# Altium schematic sheet Driver_Section.SchDoc
size A4; DocumentNumber: 6; SheetNumber: 6; SheetTotal: 8
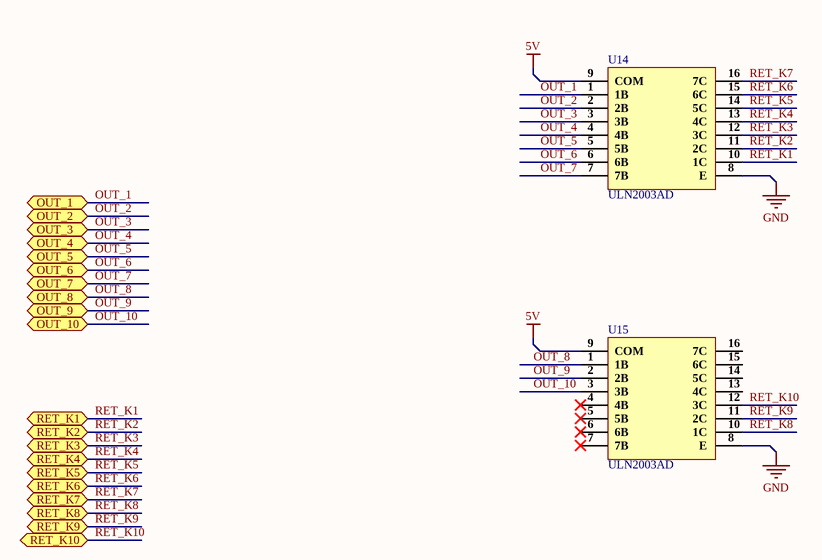
[diagram p0: Driver_Section.SchDoc]

## Parts
U14  ULN2003AD  [16-SOIC]
U15  ULN2003AD  [16-SOIC]

## Ports
OUT_1 (bidir), OUT_2 (bidir), OUT_3 (bidir), OUT_4 (bidir), OUT_5 (bidir), OUT_6 (bidir), OUT_7 (bidir), OUT_8 (bidir), OUT_9 (bidir), OUT_10 (bidir), RET_K1 (bidir), RET_K2 (bidir), RET_K3 (bidir), RET_K4 (bidir), RET_K5 (bidir), RET_K6 (bidir), RET_K7 (bidir), RET_K8 (bidir), RET_K9 (bidir), RET_K10 (bidir)

## Nets
5V: U14.9(COM) U15.9(COM)
GND: U14.8(E) U15.8(E)
OUT_1: U14.1(1B) ; port OUT_1
OUT_2: U14.2(2B) ; port OUT_2
OUT_3: U14.3(3B) ; port OUT_3
OUT_4: U14.4(4B) ; port OUT_4
OUT_5: U14.5(5B) ; port OUT_5
OUT_6: U14.6(6B) ; port OUT_6
OUT_7: U14.7(7B) ; port OUT_7
OUT_8: U15.1(1B) ; port OUT_8
OUT_9: U15.2(2B) ; port OUT_9
OUT_10: U15.3(3B) ; port OUT_10
RET_K1: U14.10(1C) ; port RET_K1
RET_K2: U14.11(2C) ; port RET_K2
RET_K3: U14.12(3C) ; port RET_K3
RET_K4: U14.13(4C) ; port RET_K4
RET_K5: U14.14(5C) ; port RET_K5
RET_K6: U14.15(6C) ; port RET_K6
RET_K7: U14.16(7C) ; port RET_K7
RET_K8: U15.10(1C) ; port RET_K8
RET_K9: U15.11(2C) ; port RET_K9
RET_K10: U15.12(3C) ; port RET_K10

Not connected (* = marked no-connect by the designer): U15 4(4B)* 5(5B)* 6(6B)* 7(7B)* 13(4C) 14(5C) 15(6C) 16(7C)

## Library data of the parts
U14 U15 = ULN2003AD: TRANS 7NPN DARL 50V 0.5A 16SOIC; Manufacturer: Texas Instruments; Max Collector Current: 500mA; Number of Elements: 7; Polarity: NPN; Collector Emitter Saturation Voltage: 1.1V; Collector-emitter Voltage-Max: 1.6V; Max Power Dissipation: 25W; Item Type: IC; Supplier 1: Arrow Electronics; Manufacturer Part Number: ULN2003AD; RoHS: Yes; Category: Integrated Circuits (ICs); Stock 1: 228; Pricing 1: 1=1.68680, 10=1.54200, 100=1.39890, 500=1.31050, 1000=1.23410 (USD); Mount: Surface Mount; Case/Package: SOIC; Number of Pins: 16; Weight: 0.004998oz; Contact Plating: Gold; Min Operating Temperature: -20°C; Max Operating Temperature: 70°C; Packaging: Rail/Tube; Collector Emitter Voltage (VCEO): 50V; Package Quantity: 40; Series: Automotive, AEC-Q100; Number of Drivers: 7; Collector Emitter Breakdown Voltage: 50V; Voltage Rating (DC): 50V; Current Rating: 500mA; Emitter Base Voltage (VEBO): 50V; Output Current: 500mA; Length: 9.9mm; Width: 3.91mm; Height: 1.58mm; Radiation Hardening: No; Lead Free: Lead Free; RoHS Compliant: Yes; Reach SVHC Compliant: Yes; ComponentLink1URL: https://datasheet.ciiva.com/15139/getdatasheetpartid-47909-15139875.pdf?src-supplier=Verical; ComponentLink1Description: https://datasheet.ciiva.com/15139/getdatasheetpartid-47909-15139875.pdf?src-supplier=Verical; ComponentLink2URL: https://datasheet.ciiva.com/1193/1908148-1193405.pdf?src-supplier=Element14; ComponentLink2Description: https://datasheet.ciiva.com/1193/1908148-1193405.pdf?src-supplier=Element14; ComponentLink3URL: https://datasheet.ciiva.com/1702/uln2003a-1702173.pdf?src-supplier=Digi-Key; ComponentLink3Description: https://datasheet.ciiva.com/1702/uln2003a-1702173.pdf?src-supplier=Digi-Key; ComponentLink4URL: https://datasheet.ciiva.com/14424/ulq2003a-14424058.pdf?src-supplier=Avnet; ComponentLink4Description: https://datasheet.ciiva.com/14424/ulq2003a-14424058.pdf?src-supplier=Avnet; Supplier Part Number 1: ULN2003AD; LCSC Part Number: C908113